# Altium schematic sheet Sheet1.SchDoc
size A; SheetNumber: 1; SheetTotal: 1
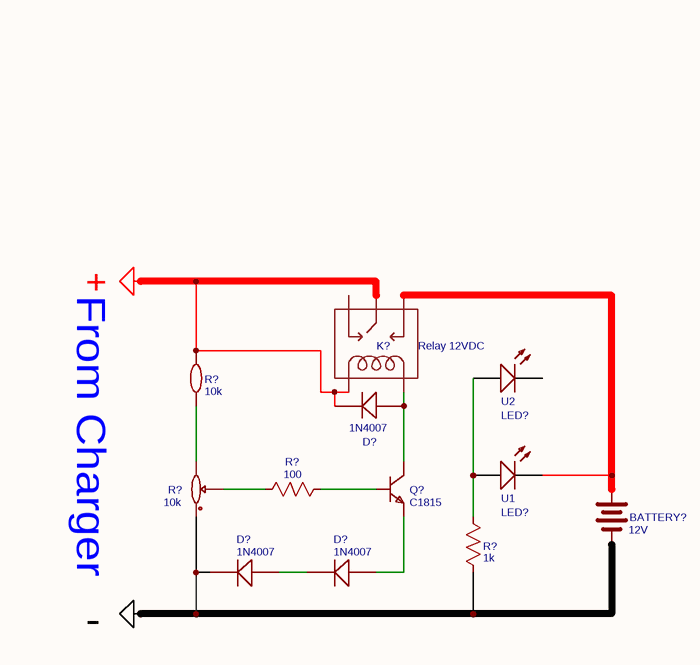
[diagram p0: Sheet1.SchDoc]

## Parts
(Parts that share a designator on the sheet are numbered #1, #2 ... from top to bottom, then left to right.)
BATTERY?  12V  [BATTERY-1]
D?#1  1N4007  [DO-35]
D?#2  1N4007  [DO-35]
D?#3  1N4007  [DO-35]
K?  Relay 12VDC  [RELAY-SRD-12VDC]
LED?#1  U2  [LED-3MM/2.54]
LED?#2  U1  [LED-3MM/2.54]
Q?  C1815  [TO-92(TO-92-3)]
R?#1  10k  [AXIAL-0.3]
R?#2  10k  [RES-ADJ_3386P]
R?#3  100  [AXIAL-0.3]
R?#4  1k  [AXIAL-0.3]

## Nets
GND: BATTERY?.2 D?#1.2(K) D?#2.2(K) K?.6(MAIN) K?.8(COIL1) R?#1.2 R?#2.3 R?#4.2
NetBATTERY?_1: BATTERY?.1 K?.4(NO) LED?#2.2(C)
NetD?#1_1: D?#1.1(A) K?.1(COIL2) Q?.3(C)
NetD?#2_1: D?#2.1(A) D?#3.2(K)
NetD?#3_1: D?#3.1(A) Q?.1(E)
NetLED?#1_1: LED?#1.1(A) LED?#2.1(A) R?#4.1
NetQ?_2: Q?.2(B) R?#3.2
NetR?#1_1: R?#1.1 R?#2.1
NetR?#2_2: R?#2.2 R?#3.1

Not connected (* = marked no-connect by the designer): K? 2(NC); LED?#1 2(C)

## Notes on the sheet
- From Charger
- +
- -

## Library data of the parts
BATTERY? = 12V: nameAlias: Value; Manufacturer Part: ?; spicePre: V; spiceSymbolName: Battery
D?#1-D?#3 = 1N4007: Manufacturer: ST; Manufacturer Part: 1N4148; Supplier: EasyEDA; spicePre: D; Supplier Part: E14516
K? = Relay 12VDC: catid: 20; sourceId: _ioXVvt31m; Manufacturer Part: ?; spicePre: U
LED?#1 = U2: Manufacturer: EVERLIGHT; Manufacturer Part: 204-10UYC/S530-A3; Supplier: LCSC; spicePre: L; Supplier Part: C73643
LED?#2 = U1: Manufacturer: EVERLIGHT; Manufacturer Part: 204-10UYC/S530-A3; Supplier: LCSC; spicePre: L; Supplier Part: C73643
Q? = C1815: Manufacturer: CJ; Manufacturer Part: 2N3904; Supplier: EasyEDA; spicePre: Q; Supplier Part: E2081
R?#1 = 10k: nameAlias: Value(Ω); Manufacturer Part: ?; spicePre: R; spiceSymbolName: Resistor
R?#2 = 10k: nameAlias: Value(Ω); Model: Potentiometer; K(%): 50; spicePre: X; Manufacturer Part: ?; spiceSymbolName: Potentiometer
R?#3 = 100: nameAlias: Value(Ω); Manufacturer Part: ?; spicePre: R; spiceSymbolName: Resistor
R?#4 = 1k: nameAlias: Value(Ω); Manufacturer Part: ?; spicePre: R; spiceSymbolName: Resistor